# Altium project VSCPU_TestBoard_v2.PrjPcb
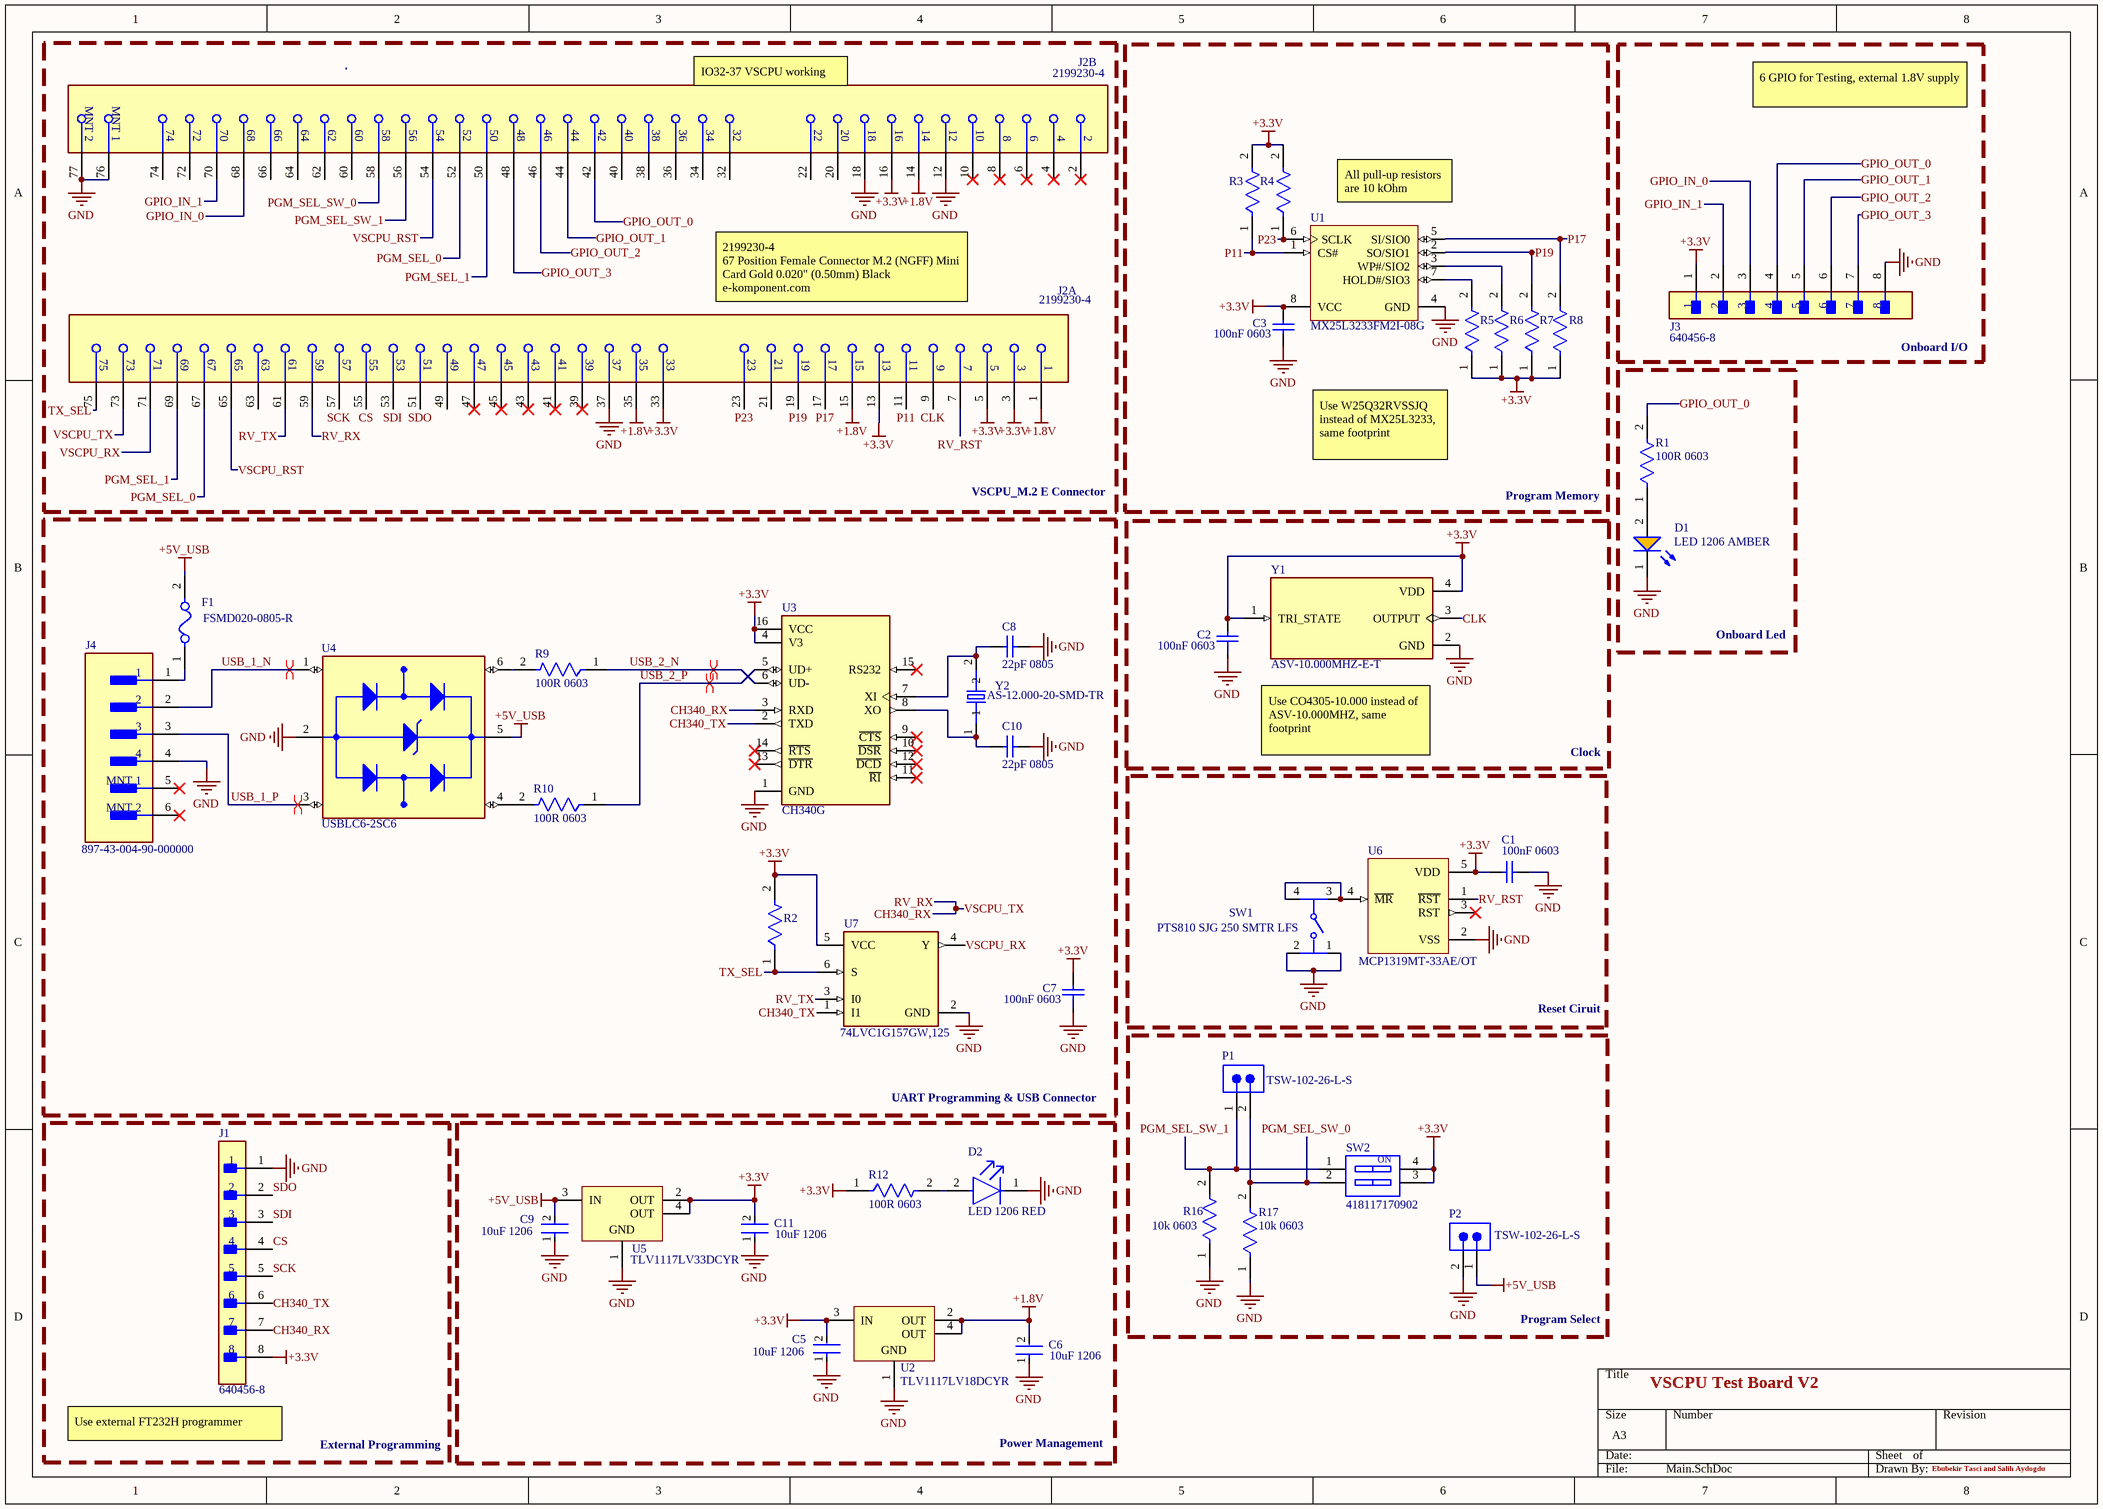
[diagram p0: Main.SchDoc]
1 sheet, 43 parts. Net scope: global (net labels, ports and power ports of the same name join across sheets).
Board file: Main.PcbDoc

## Sheet Main.SchDoc
size A3; SheetNumber: 1; SheetTotal: 1

### Parts
C1  100nF 0603  [CAPC1608X90X35NL15T15]
C2  100nF 0603  [CAPC1608X90X35NL15T15]
C3  100nF 0603  [CAPC1608X90X35NL15T15]
C5  10uF 1206  [FP-CC1206-FD-MFG]
C6  10uF 1206  [FP-CC1206-FD-MFG]
C7  100nF 0603  [CAPC1608X90X35NL15T15]
C8  22pF 0805  [CAPC2013X145X48ML20T23]
C9  10uF 1206  [FP-CC1206-FD-MFG]
C10  22pF 0805  [CAPC2013X145X48ML20T23]
C11  10uF 1206  [FP-CC1206-FD-MFG]
D1  LED 1206 AMBER  [WL-SMCW_1206_150120xx75000]
D2  LED 1206 RED  [FP-LTST-C150KRKT-MFG]
F1  FSMD020-0805-R  [FP-0805L-MFG]
J1  640456-8  [FP-640456-8-MFG]
J2  2199230-4  [FP-2199230-4-MFG]  (parts A,B of 2)
J3  640456-8  [FP-640456-8-MFG]
J4  897-43-004-90-000000  [FP-897-43-004-90-000000-MFG]
P1  TSW-102-26-L-S  [SMTC-TSW-102-26-XX-S]
P2  TSW-102-26-L-S  [SMTC-TSW-102-26-XX-S]
R1  100R 0603  [FP-RT0603-MFG]
R2  10k 0603  [FP-AC0603-IPC_A]  (value not drawn)
R3  10k 0603  [FP-AC0603-IPC_A]  (value not drawn)
R4  10k 0603  [FP-AC0603-IPC_A]  (value not drawn)
R5  10k 0603  [FP-AC0603-IPC_A]  (value not drawn)
R6  10k 0603  [FP-AC0603-IPC_A]  (value not drawn)
R7  10k 0603  [FP-AC0603-IPC_A]  (value not drawn)
R8  10k 0603  [FP-AC0603-IPC_A]  (value not drawn)
R9  100R 0603  [FP-RT0603-MFG]
R10  100R 0603  [FP-RT0603-MFG]
R12  100R 0603  [FP-RT0603-MFG]
R16  10k 0603  [FP-AC0603-IPC_A]
R17  10k 0603  [FP-AC0603-IPC_A]
SW1  PTS810 SJG 250 SMTR LFS  [FP-PTS810_SJG_250_SMTR_LF-MFG]
SW2  418117170902  [418117170902]
U1  MX25L3233FM2I-08G  [MXIC-SOP-8_N]
U2  TLV1117LV18DCYR  [DCY0004A_M]
U3  CH340G  [SOIC127P600X180-16N]
U4  USBLC6-2SC6  [SOT95P280X145-6N]
U5  TLV1117LV33DCYR  [DCY0004A_N]
U6  MCP1319MT-33AE/OT  [SOT-23-OT5_M]
U7  74LVC1G157GW,125  [FP-SOT363-MFG]
Y1  ASV-10.000MHZ-E-T  [XTAL_ASV-10.000MHZ-E-T]
Y2  AS-12.000-20-SMD-TR  [XTAL1170X500X450]

### Blocks framed on the sheet
VSCPU_M.2 E Connector: J2
Program Memory: C3 R3-R8 U1
Onboard I/O: J3
Onboard Led: D1 R1
UART Programming & USB Connector: C7 C8 C10 F1 J4 R2 R9 R10 U3 U4 U7 Y2
Program Select: P1 P2 R16 R17 SW2
External Programming: J1

### Nets
+1.8V: C6.2 J2.1 J2.14 J2.15 J2.35 U2.2(OUT) U2.4(OUT)
+3.3V: C1.2 C2.2 C3.2 C5.2 C7.2 C11.2 J1.8 J2.3 J2.5 J2.13 J2.16 J2.33 J3.1 R2.2 R3.2 R4.2 R5.1 R6.1 R7.1 R8.1 R12.1 SW2.3 SW2.4 U1.8(VCC) U2.3(IN) U3.4(V3) U3.16(VCC) U5.2(OUT) U5.4(OUT) U6.5(VDD) U7.5(VCC) Y1.1(TRI_STATE) Y1.4(VDD)
+5V_USB: C9.2 F1.2 P2.1 U4.5(VBUS) U5.3(IN)
GND: C1.1 C2.1 C3.1 C5.1 C6.1 C7.1 C8.2 C9.1 C10.2 C11.1 D1.1(K) D2.1(C) J1.1 J2.12 J2.18 J2.37 J2.76(MNT_1) J2.77(MNT_2) J3.8 J4.4 P2.2 R16.1 R17.1 SW1.1 SW1.2 U1.4(GND) U2.1(GND) U3.1(GND) U4.2(GND) U5.1(GND) U6.2(VSS) U7.2(GND) Y1.2(GND)
CH340_RX: J1.7 J2.59 J2.73 U3.3(RXD)  [also labelled RV_RX, VSCPU_TX]
CH340_TX: J1.6 U3.2(TXD) U7.1(I1)
CLK: J2.9 Y1.3(OUTPUT)
CS: J1.4 J2.55
GPIO_IN_0: J2.68 J3.3
GPIO_IN_1: J2.70 J3.2
GPIO_OUT_0: J2.42 J3.4 R1.2
GPIO_OUT_1: J2.44 J3.5
GPIO_OUT_2: J2.46 J3.6
GPIO_OUT_3: J2.48 J3.7
P11: J2.11 R3.1 U1.1(CS#)
P17: J2.17 R8.2 U1.5(SI/SIO0)
P19: J2.19 R7.2 U1.2(SO/SIO1)
P23: J2.23 R4.1 U1.6(SCLK)
PGM_SEL_0: J2.52 J2.67
PGM_SEL_1: J2.50 J2.69
PGM_SEL_SW_0: J2.58 P1.2 R17.2 SW2.2
PGM_SEL_SW_1: J2.56 P1.1 R16.2 SW2.1
RV_RST: J2.7 U6.1(~{RST})
RV_TX: J2.61 U7.3(I0)
SCK: J1.5 J2.57
SDI: J1.3 J2.53
SDO: J1.2 J2.51
TX_SEL: J2.75 R2.1 U7.6(S)
USB_1_N: J4.2 U4.1(I/O1_IN)
USB_1_P: J4.3 U4.3(I/O2_IN)
USB_2_N: R9.1 U3.6(UD-)
USB_2_P: R10.1 U3.5(UD+)
VSCPU_RST: J2.54 J2.65
VSCPU_RX: J2.71 U7.4(Y)
NetC8_1: C8.1 U3.7(XI) Y2.2
NetC10_1: C10.1 U3.8(XO) Y2.1
NetD1_2: D1.2(A) R1.1
NetD2_2: D2.2(A) R12.2
NetF1_1: F1.1 J4.1
NetR5_2: R5.2 U1.7(HOLD#/SIO3)
NetR6_2: R6.2 U1.3(WP#/SIO2)
NetR9_2: R9.2 U4.6(I/O1_OUT)
NetR10_2: R10.2 U4.4(I/O2_OUT)
NetSW1_3: SW1.3 SW1.4 U6.4(~{MR})

Not connected (* = marked no-connect by the designer): J2 2* 4* 6* 8* 10* 20 21 22 32 34 36 38 39* 40 41* 43* 45* 47* 49 60 62 63 64 66 72 74; J4 5(MNT_1)* 6(MNT_2)*; U3 9(~{CTS})* 10(~{DSR})* 11(~{RI})* 12(~{DCD})* 13(~{DTR})* 14(~{RTS})* 15(RS232)*; U6 3(RST)*

### Layout directives
differential pair: USB_1_N, USB_1_P, USB_2_N, USB_2_P

### Notes on the sheet
- IO32-37 VSCPU working
- 6 GPIO for Testing, external 1.8V supply
- All pull-up resistors are 10 kOhm
- 2199230-4
  67 Position Female Connector M.2 (NGFF) Mini Card Gold 0.020" (0.50mm) Black
  e-komponent.com
- Use W25Q32RVSSJQ instead of MX25L3233, same footprint
- Use CO4305-10.000 instead of ASV-10.000MHZ, same footprint
- Clock
- Reset Ciruit
- VSCPU Test Board V2
- (near J1) Use external FT232H programmer
- Power Management
- Ebubekir Tasci and Salih Aydogdu
- (in symbol CMP-1434-00002-4) ON

### Library data of the parts
C1-C3 C7 = CMP-2006-02299-1: Part Number: C0603C104K4RAC7013; Manufacturer: Kemet
C5 C6 C9 C11 = CMP-03422-001420-1: CAP CER 10UF 50V X5R 1206 / CC1206KKX5R9BB106; Tolerance: 10%; Voltage Rating (DC): 50V; Width: 0.063inch; Halogen Free: Halogen Free; Mount: Surface Mount; Dielectric: X5R; Max Operating Temperature: 85°C; Capacitance: 10uF; Case/Package: 1206; Voltage Rating: 50V; Lead Free: Lead Free; Thickness: 0.075inch; Min Operating Temperature: -55°C; Length: 0.126inch; Packaging: Tape and Reel; RoHS Compliant: Yes
C8 C10 = CMP-2007-01710-1: Manufacturer: Vitramon; Part Number: VJ0805A220KXAMC
D1 = CMP-1426-00018-5: Led, 1206, Amber, 140Mcd, 605Nm;; Manufacturer Lifecycle Status: ACTIVE; Lens Style: Clear, Rectangular; Forward Current: 100mA; Peak Wavelength: 610nm; Viewing Angle: 140°; Test Current: 20mA; Forward Voltage: 2V; Color: Orange; Max Reverse Voltage (DC): 5V; YEOL: 1 = Estimated lifetime > 10 years; Width: 1.6mm; RoHS: Compliant; Min Operating Temperature: -40°C; Case Code (Imperial): 1206; Packaging: Tape and Reel; Length: 3.2mm; Case Code (Metric): 3216; Wavelength: 605nm; Max Operating Temperature: 85°C; Luminous Intensity: 140mcd; Height: 680µm; Mount: Surface Mount; Case/Package: 1206; Dominant Wavelength: 605nm; REACH SVHC: Unknown; Lifecycle Status: Production
D2 = CMP-2000-06617-2: LED RED CLEAR 1206 SMD / LTST-C150KRKT; Wavelength: 639nm; Power Dissipation: 62.5mW; Luminous Intensity: 54mcd; Test Current: 20mA; Forward Current: 30mA; Reverse Voltage: 5V; Viewing Angle: 130°; Number of Elements: 1; Lens Style: Diffused; Power Rating: 75mW; Lens Color: Colorless; Forward Voltage: 2V; Dominant Wavelength: 631nm; Depth: 1.6mm; Mount: Surface Mount; Packaging: Tape and Reel; Case Code (Metric): 3216; Lens Transparency: Clear; Illumination Color: Red; Radiation Hardening: No; Min Operating Temperature: -30°C; Height: 1.1mm; Case Code (Imperial): 1206; Number of Pins: 2; Length: 3.2mm; Lead Free: Lead Free; Color: Red; Width: 1.6mm; Number of LEDs: 1; Max Operating Temperature: 85°C; Case/Package: 1206; Package Quantity: 1
F1 = CMP-08606-000023-1: PTC RESET FUSE 9V 200MA 0805; Manufacturer Part Number: 0805L050WR; Manufacturer: Littelfuse Inc.; Hold Current: 0.2A; Value: 0.15-0.85Ω; Trip Time: 0.1s; Trip Current: 1A; Voltage Rating: 6V; Device Class L2: PTC Resettable Fuses; Digikey Description: PTC RESET FUSE 6V 500MA 0805; Package: 0805L; RoHS: TRUE; Temperature Range Low: -40°C; Octopart: https://octopart.com/0805l050wr-littelfuse-673858; Resistance: 0.15-0.85Ω; Category: Fuse; Height: 1.25mm; Ambient Temperature Range High: +85°C; Automotive: No; Device Class L3: unset; Lead Free: Yes; Temperature: -40°C to +85°C; Ambient Temperature Range Low: -40°C; Temperature Range High: +85°C; Device Class L1: Circuit Protection
J1 J3 = CMP-03369-000098-1: CONN HEADER VERT 8POS 2.54MM; RoHS Compliant: Yes
J2 = CMP-03365-000002-1: CONN FEMALE 67POS 0.020 GOLD; Manufacturer: TE Connectivity; Conn Orientation: Right Angle; Pitch: 0.5mm; Number Of Contacts: 67; Voltage Rating: 50V; Is Female: yes; Current Rating: 0.5A; Lead Free: Yes; Temperature Range Low: -40°C; Device Class L3: unset; Package: 0; Manufacturer Part Number: 2199230-4; RoHS: TRUE; Digikey Description: CONN FEMALE 67POS 0.020 GOLD; Category: Conn; Device Class L1: Connectors; Temperature Range High: +80°C; ComponentLink2Description: Datasheet; ComponentLink2URL: https://www.te.com/commerce/DocumentDelivery/DDEController?Action=showdoc&DocId=Customer+Drawing%7F2199230%7FB3%7Fpdf%7FEnglish%7FENG_CD_2199230_B3.pdf%7F2199230-4; Mouser Description: PCI Express / PCI Connectors .5PITCH 4.2H KEY E EMBOSS NGFF MINICARD; Automotive: No; Conn Gender: Female; Height: 4.2mm; Device Class L2: Card Edge Connectors; Contact Material: Gold,Nickel; Number Of Rows: 2; Octopart: https://octopart.com/2199230-4-te+connectivity-46436156; Temperature: -40°C to +80°C
J4 = CMP-07782-000001-1: CONN RCPT USB2.0 TYPEB 4POS R/A; Max Voltage Rating (AC): 30V; Number of Positions: 4; Gender: Receptacle; Connector Type: USB; Number of Ports: 1; Insulation Resistance: 1GR; Max Current Rating: 1A; Lead Free: Lead Free; Contact Plating: Gold; Flammability Rating: UL94 V-0; Length: 12.03mm; Depth: 16mm; Packaging: Tray; Mount: Through Hole; Termination: Through Hole; Number of Terminals: 4; Package Quantity: 150; Contact Material: Copper Alloy; Housing Material: Thermoplastic; Number of Contacts: 4; USB Standard: USB 2.0; Orientation: Right Angle; REACH SVHC: No SVHC
P1 P2 = CMP-1024-00330-1: 0.025" SQ Post Header, Through-hole, Vertical, -55 to 125 degC, 2.54 mm Pitch, 2-Pin, Male, RoHS; Manufacturer: Samtec; Pitch: 2.54 mm; DatasheetVersion: F-214; PackageReference: TSW-102-26-XX-S; ComponentLink3Description: Package Specification; PackageDescription: .025[0.64] SQ. Post Terminal Strip Assembly; PackageVersion: DM, 8/1988; ComponentLink1Description: Manufacturer URL; ComponentLink2URL: http://www.samtec.com/documents/webfiles/pdf/TSW_TH.PDF; ComponentLink3URL: http://www.samtec.com/documents/webfiles/cpdf/TSW-XXX-XX-XXX-X-XX-XXX-MKT.pdf; ComponentLink2Description: Datasheet; Temperature Range: -55 to 125 degC; Mounting Technology: Through-hole; ComponentLink1URL: http://www.samtec.com; RoHS: True; PartNumber: TSW-102-26-L-S; Orientation: Vertical
R1 R9 R10 R12 = CMP-03412-003691-1: Res Thin Film 0603 100 Ohm 0.1% 1/10W ±10ppm/°C Molded SMD Paper T/R; Manufacturer Part Number: RT0603BRB07100RL; Manufacturer: Yageo; Value: 100Ω; Tolerance: 0.001; Voltage Rating: 75V; Power Rating: 0.1W; ComponentLink2Description: Datasheet; Mouser Description: Thin Film Resistors 1/10W 100 ohm .1% 10ppm; Package: RT0603; Composition: Thin Film; Height: 0.55mm; Temperature Range Low: -55°C; Series: RT; Footprint Url: http://www.yageo.com/exep/pages/download/literatures/PYu-R_Mount_10.pdf; Temperature Range High: +155°C; Category: Res; Digikey Description: Res Thin Film 0603 100 Ohm 0.1% 1/10W ±10ppm/°C Molded SMD Paper T/R; Ipc Land Pattern Name: RESC16080X45; Device Class L1: Passive Components; Device Class L3: Chip SMD Resistors; Automotive: No; Temperature Coefficient: 10 ppm/°C; Temperature: -55°C to +155°C; Lead Free: Yes; RoHS: TRUE; Octopart: https://octopart.com/rt0603brb07100rl-yageo-30314052; ComponentLink2URL: http://www.yageo.com/documents/recent/PYu-RT_1-to-0.01_RoHS_L_9.pdf; Device Class L2: Resistors; Resistance: 100Ω
R2-R8 R16 R17 = CMP-03412-040683-1: RES 10kΩ 5.00% 0.2W 0603
SW1 = CMP-10040-000011-1: SWITCH TACTILE SPST-NO 0.05A 16V; Manufacturer: C&K Components; Electromechanical Life: 100000Cycles; Contact Resistance: 500mΩ; Operating Force: 400gf; Current Rating: 50mA; Voltage Rating Dc: 16V; Device Class L2: Switches; Device Class L1: Electromechanical; ComponentLink2URL: https://www.ckswitches.com/media/1476/pts810.pdf; Digikey Description: SWITCH TACTILE SPST-NO 0.05A 16V; RoHS: TRUE; Temperature Range Low: -40°C; Temperature Range High: +85°C; Automotive: No; Category: Switch; ComponentLink2Description: Datasheet; Device Class L3: Tactile Switches; Mouser Description: Switch Tactile N.O. SPST Button J-Bend 0.05A 16VDC 100000Cycles 3.92N SMD T/R; Throw Configuration: SPST-NO; Package: PTS810 SJG 250 SMTR LFS; Height: 2.7mm; Octopart: https://octopart.com/pts810sjg250smtrlfs-c%26k+components-29380277; Manufacturer Part Number: PTS810 SJG 250 SMTR LFS; Temperature: -40°C to +85°C; Lead Free: Yes
SW2 = CMP-1434-00002-4: Dip Switch, 0.025A, 24Vdc, 2 Pos, Tht Rohs Compliant: Yes; Manufacturer Lifecycle Status: ACTIVE; Mechanical Life: 2kcycles; Throw Configuration: SPST; Number of Positions: 2; Pitch: 2.54mm; Voltage Rating: 24V; Body Material: PBT, Polybutylene; Current Rating: 25mA; YEOL: 1 = Estimated lifetime > 10 years; Insulation Resistance: 100MΩ; Washable: No; RoHS: Compliant; Max Operating Temperature: 85°C; Termination: PC Pin; Contact Plating: Gold; Electrical Life: 2kcycles; Lifecycle Status: Production; Voltage Rating (DC): 24V; Min Operating Temperature: -40°C; Length: 6.08mm
U1 = CMP-2000-05278-1: CMOS MXSMIO(R) (Serial Multi I/O) Flash Memory, 32 Mbits (x1/x2/x4), 3 V, -40 to 85 degC, 8-Pin SOP; Manufacturer: Macronix; Manufacturer URL: http://www.macronix.com; Package Description: 8-Pin Small Outline Package, Body 5.23 x 5.28 mm, Pitch 1.27 mm; Datasheet URL: http://datasheet.octopart.com/MX25L3233FM2I-08G-Macronix-datasheet-38883555.pdf; Datasheet Version: Rev. 1.1, 01/2015; Package Reference: SOP-8
U2 = CMP-0395-00524-2: Single Output LDO, 1 A, Fixed 1.8 V Output, 2 to 5.5 V Input, 4-pin SOT-223 (DCY), -40 to 125 degC, Green (RoHS & no Sb/Br); Manufacturer: Texas Instruments; Iout(Max)(A): 1; SubFamily: Single Channel LDO; Vin(Min)(V): 2; Vout Adj(Min)(V): 1.8; Vin(Max)(V): 5.5; Iq(Typ)(mA): 0.05; Vdo(Typ)(mV): 1200; Eco-Plan: Green (RoHS & no Sb/Br); PackageDescription: 4-Pin Plastic Small Outline, Body 3.5 x 6.5 mm, Pitch 2.3 mm; ComponentLink3Description: Package Specification; ComponentLink2Description: Datasheet; PackageVersion: 4202506/B; ComponentLink1Description: Manufacturer URL; ComponentLink2URL: http://www.ti.com/general/docs/lit/getliterature.tsp?genericPartNumber=TLV1117LV18&fileType=pdf; Fixed Output Options(V): 1.8; Accuracy(%): 2; Vout Adj(Max)(V): 1.8; ComponentLink3URL: http://www.ti.com/litv/pdf/mpds094a; PackageReference: DCY0004A; ComponentLink1URL: http://www.ti.com/; Mounting Technology: Surface Mount; DatasheetVersion: SBVS160A; PartNumber: TLV1117LV18DCYR; Code_JEDEC: TO-261
U3 = CMP-064-000000-1: USB Interface Integrated Circuit; MF: WCH; Source: CH340G.SchLib; MP: Ch340G; Value: *; Package: None; Component Type: Standard; Availability: Not in stock; SnapEDA_Link: https://www.snapeda.com/parts/Ch340G/WCH/view-part/?ref=snap; Pin Count: 16; Check_prices: https://www.snapeda.com/parts/Ch340G/WCH/view-part/?ref=eda; Price: None; Design Item ID: CH340G
U4 = CMP-004-00031-1: 17V Clamp 5A (8/20Âµs) Ipp Tvs Diode Surface Mount SOT-23-6; MF: STMicroelectronics; Pins: 6; Value: *; Component Type: Standard; Design Item ID: USBLC6-2SC6; MP: USBLC6-2SC6; Availability: In Stock; Source: USBLC6-2SC6.SchLib; Price: None; Check_prices: https://www.snapeda.com/parts/USBLC6-2SC6/STMicroelectronics/view-part/?ref=eda; Case/Package: SOT-23-6 STMicroelectronics; SnapEDA_Link: https://www.snapeda.com/parts/USBLC6-2SC6/STMicroelectronics/view-part/?ref=snap; Purchase-URL: https://pricing.snapeda.com/search/part/USBLC6-2SC6/?ref=eda
U5 = CMP-0395-00503-2: Single Output LDO, 1 A, Fixed 3.3 V Output, 2 to 5.5 V Input, 4-pin SOT-223 (DCY), -40 to 125 degC, Green (RoHS & no Sb/Br); Manufacturer: Texas Instruments; Vout Adj(Min)(V): 3.3; Vdo(Typ)(mV): 1200; Iq(Typ)(mA): 0.05; Accuracy(%): 2; Iout(Max)(A): 1; SubFamily: Single Channel LDO; Vin(Max)(V): 5.5; PackageReference: DCY0004A; PackageDescription: 4-Pin Plastic Small Outline, Body 3.5 x 6.5 mm, Pitch 2.3 mm; Vout Adj(Max)(V): 3.3; Mounting Technology: Surface Mount; ComponentLink2Description: Datasheet; ComponentLink1Description: Manufacturer URL; PartNumber: TLV1117LV33DCYR; ComponentLink3Description: Package Specification; ComponentLink1URL: http://www.ti.com/; ComponentLink2URL: http://www.ti.com/general/docs/lit/getliterature.tsp?genericPartNumber=TLV1117LV33&fileType=pdf; Fixed Output Options(V): 3.3; PackageVersion: 4202506/B; Vin(Min)(V): 2; DatasheetVersion: SBVS160A; Eco-Plan: Green (RoHS & no Sb/Br); ComponentLink3URL: http://www.ti.com/litv/pdf/mpds094a; Code_JEDEC: TO-261
U6 = CMP-0138-00181-1: Voltage Supervisor, 5-Pin SOT-23, Extended Temperature, Tape and Reel; PackageReference: SOT-23-OT5; DatasheetVersion: revB, Oct-2007; Code_IPC: SOT23-5; PackageDescription: 5-Lead Plastic Small Outline Transistor (OT) [SOT-23]; PackageVersion: revBB, Aug-2009
U7 = CMP-14348-000001-1: IC SINGLE 2-INPUT MUX 6TSSOP; Manufacturer: Nexperia; Logic Function Desc: Non-inverting; Number Of Inputs: 2; Number Of Circuits: 1; Nominal Supply Current: 0.1uA; Min Supply Voltage: 1.65V; Max Supply Voltage: 5.5V; Propagation Delay: 2.2ns; Manufacturer Part Number: 74LVC1G157GW,125; RoHS: TRUE; Device Class L3: Multiplexers; ComponentLink2Description: Datasheet; Ambient Temperature Range Low: -40°C; Height: 1.1mm; Octopart: https://octopart.com/74lvc1g157gw%2C125-nexperia-78736121; Lead Free: Yes; Number Of Outputs: 1; Temperature Range Low: -40°C; Footprint Url: https://assets.nexperia.com/documents/outline-drawing/SOT363.pdf; Mouser Description: 74LVC Series 3.3 V Surface Mount Single 2-Input Multiplexer - SC-88; Ambient Temperature Range High: +125°C; Automotive: No; Package: SOT363; Temperature Range High: +125°C; Digikey Description: IC SINGLE 2-INPUT MUX 6TSSOP; Device Class L2: Logic ICs; Temperature: -40°C to +125°C; Category: IC; ComponentLink2URL: https://assets.nexperia.com/documents/data-sheet/74LVC1G157.pdf; Device Class L1: Integrated Circuits (ICs)
Y1 = CMP-033-000000-1: Source: ASV-10.000MHZ-E-T.SchLib; Price: None; Value: *; Pin Count: 4; MP: ASV-10.000MHZ-E-T; Package: None; Availability: Unavailable; Component Type: Standard; Design Item ID: ASV-10.000MHZ-E-T
Y2 = CMP-003-00030-1: CRYSTAL, 12MHz, 20PF, SMD; Frequency:12MHz; Frequency Tolerance:Â± 30ppm; Load Capacitance:20pF; Operating Temperature Range:-20Â°C to +70Â°C; Crystal Mounting Type:SMD; Crystal Case Type:HC-49S; No. of Pins:2; MSL:MSL 1 - Unlimited; MF: Fox Electronics; SnapEDA_Link: https://www.snapeda.com/parts/FOXSDLF/120-20/Fox+Electronics/view-part/?ref=snap; Case/Package: HC49SD Fox Electronics; MP: FOXSDLF/120-20; Source: FOXSDLF_120-20.SchLib; Pins: 2; Component Type: Standard; Check_prices: https://www.snapeda.com/parts/FOXSDLF/120-20/Fox+Electronics/view-part/?ref=eda; Value: *; Design Item ID: FOXSDLF/120-20